# EAGLE design cloudline_controller (EAGLE 9.6.2)
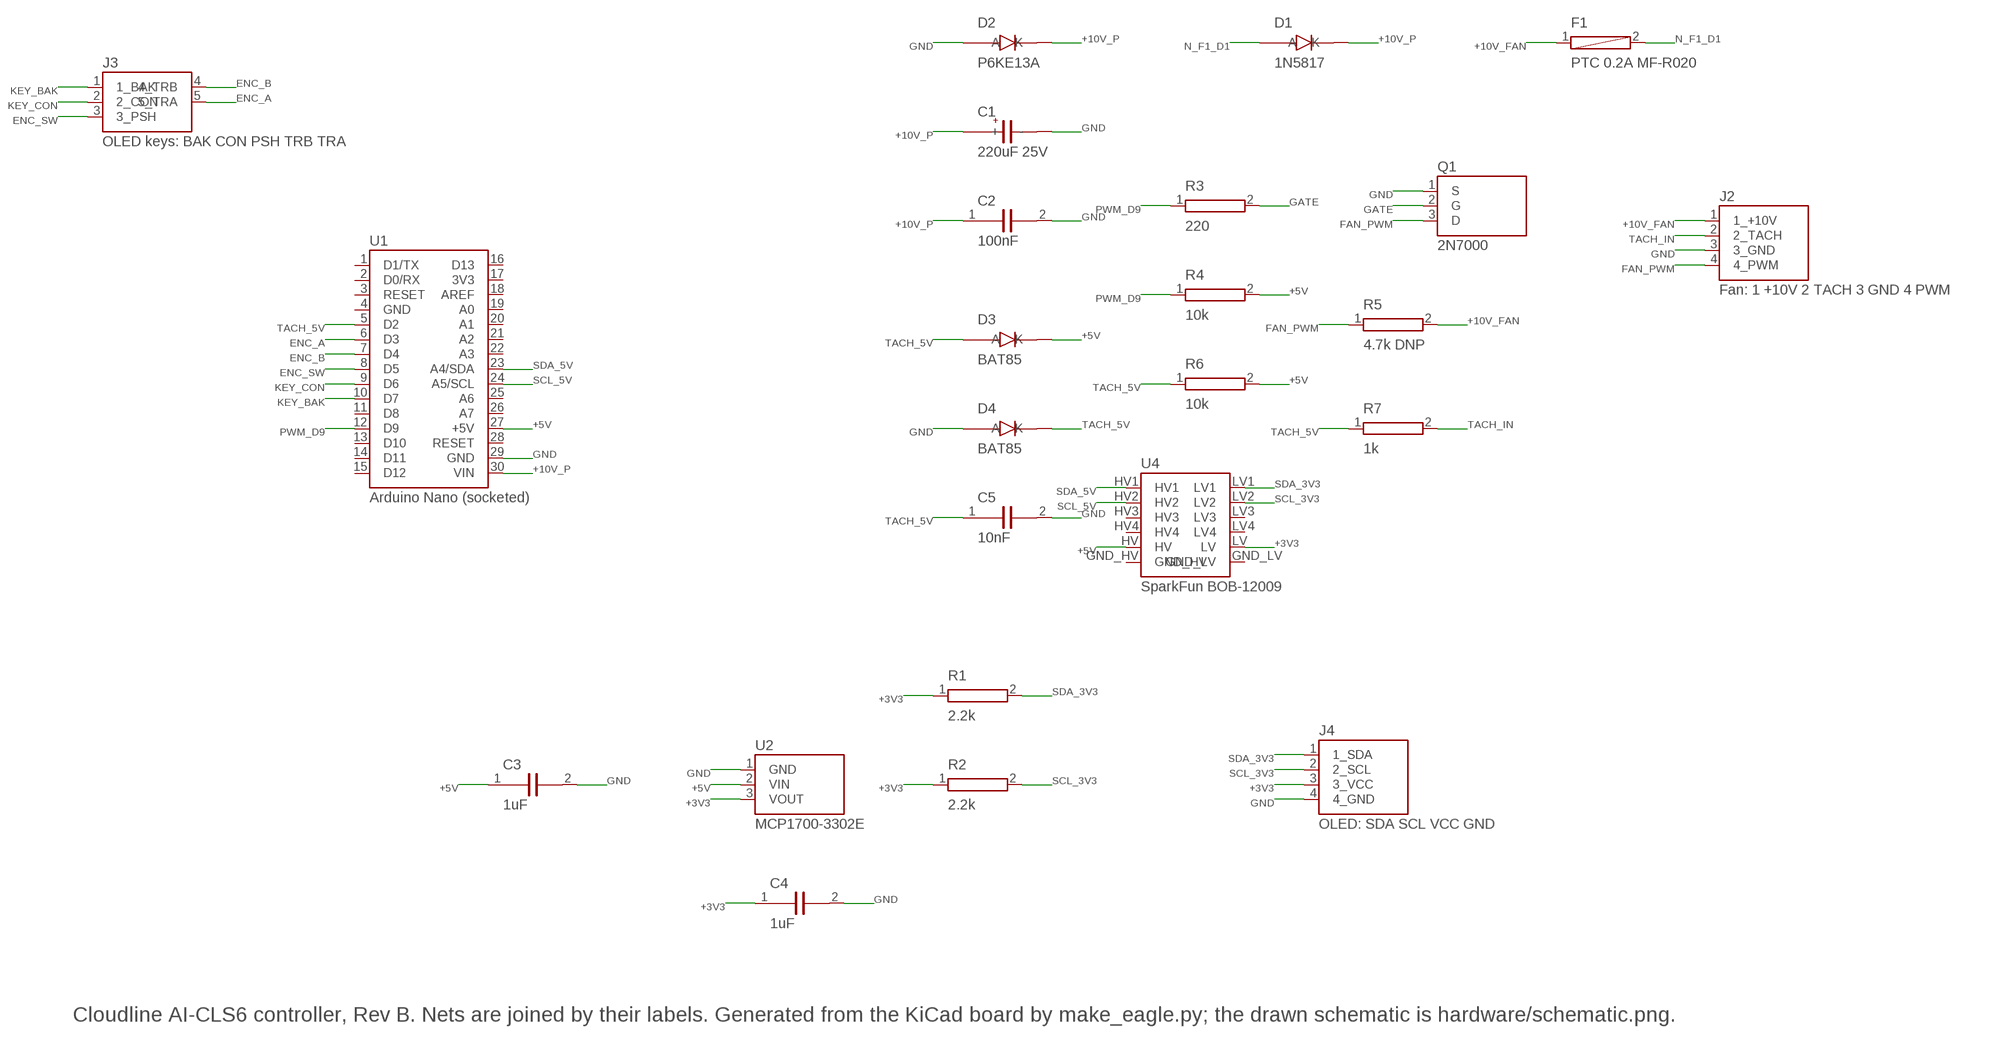
[diagram p0: schematic, sheet 1]

## Parts
C1  220uF 25V  DEV_C1  [CP_Radial_D8.0mm_P3.50mm]
C2  100nF  DEV_C2  [C_Disc_D5.0mm_W2.5mm_P5.00mm]
C3  1uF  DEV_C3  [C_Disc_D5.0mm_W2.5mm_P5.00mm]
C4  1uF  DEV_C4  [C_Disc_D5.0mm_W2.5mm_P5.00mm]
C5  10nF  DEV_C5  [C_Disc_D5.0mm_W2.5mm_P5.00mm]
D1  1N5817  DEV_D1  [D_DO-41_SOD81_P10.16mm_Horizontal]
D2  P6KE13A  DEV_D2  [D_DO-15_P12.70mm_Horizontal]
D3  BAT85  DEV_D3  [D_DO-34_SOD68_P7.62mm_Horizontal]
D4  BAT85  DEV_D4  [D_DO-34_SOD68_P7.62mm_Horizontal]
F1  PTC 0.2A MF-R020  DEV_F1  [PTC_Radial_P5.10mm]
J2  Fan: 1 +10V 2 TACH 3 GND 4 PWM  DEV_J2  [TerminalBlock_Phoenix_MKDS-1_5-4-5.08_1x04_P5.08mm_Horizontal_PAD3.3]
J3  OLED keys: BAK CON PSH TRB TRA  DEV_J3  [PinHeader_1x05_P2.54mm_Vertical]
J4  OLED: SDA SCL VCC GND  DEV_J4  [PinHeader_1x04_P2.54mm_Vertical]
Q1  2N7000  DEV_Q1  [TO-92_Inline_Wide]
R1  2.2k  DEV_R1  [R_Axial_DIN0207_L6.3mm_D2.5mm_P2.54mm_Vertical]
R2  2.2k  DEV_R2  [R_Axial_DIN0207_L6.3mm_D2.5mm_P2.54mm_Vertical]
R3  220  DEV_R3  [R_Axial_DIN0207_L6.3mm_D2.5mm_P7.62mm_Horizontal]
R4  10k  DEV_R4  [R_Axial_DIN0207_L6.3mm_D2.5mm_P10.16mm_Horizontal]
R5  4.7k DNP  DEV_R5  [R_Axial_DIN0207_L6.3mm_D2.5mm_P10.16mm_Horizontal]
R6  10k  DEV_R6  [R_Axial_DIN0207_L6.3mm_D2.5mm_P7.62mm_Horizontal]
R7  1k  DEV_R7  [R_Axial_DIN0207_L6.3mm_D2.5mm_P10.16mm_Horizontal]
U1  Arduino Nano (socketed)  DEV_U1  [Arduino_Nano]
U2  MCP1700-3302E  DEV_U2  [TO-92_Inline_Wide]
U4  SparkFun BOB-12009  DEV_U4  [SparkFun_BOB-12009]

## Nets
+3V3: C4.1 J4.3(3_VCC) R1.1 R2.1 U2.3(VOUT) U4.LV
+5V [power]: C3.1 D3.1(K) R4.2 R6.2 U1.27(+5V) U2.2(VIN) U4.HV
+10V_FAN [power]: F1.1 J2.1(1_+10V) R5.2
+10V_P [power]: C1.1(+) C2.1 D1.1(K) D2.1(K) U1.30(VIN)
ENC_A: J3.5(5_TRA) U1.6(D3)
ENC_B: J3.4(4_TRB) U1.7(D4)
ENC_SW: J3.3(3_PSH) U1.8(D5)
FAN_PWM: J2.4(4_PWM) Q1.3(D) R5.1
GATE: Q1.2(G) R3.2
GND [power]: C1.2(-) C2.2 C3.2 C4.2 C5.2 D2.2(A) D4.2(A) J2.3(3_GND) J4.4(4_GND) Q1.1(S) U1.29(GND) U2.1(GND)
KEY_BAK: J3.1(1_BAK) U1.10(D7)
KEY_CON: J3.2(2_CON) U1.9(D6)
N_F1_D1 [power]: D1.2(A) F1.2
PWM_D9: R3.1 R4.1 U1.12(D9)
SCL_3V3: J4.2(2_SCL) R2.2 U4.LV2
SCL_5V: U1.24(A5/SCL) U4.HV2
SDA_3V3: J4.1(1_SDA) R1.2 U4.LV1
SDA_5V: U1.23(A4/SDA) U4.HV1
TACH_5V: C5.1 D3.2(A) D4.1(K) R6.1 R7.1 U1.5(D2)
TACH_IN: J2.2(2_TACH) R7.2
Unconnected: U1.1(D1/TX) U1.2(D0/RX) U1.3(RESET) U1.4(GND) U1.11(D8) U1.13(D10) U1.14(D11) U1.15(D12) U1.16(D13) U1.17(3V3) U1.18(AREF) U1.19(A0) U1.20(A1) U1.21(A2) U1.22(A3) U1.25(A6) U1.26(A7) U1.28(RESET) U4.GND_HV U4.GND_LV U4.HV3 U4.HV4 U4.LV3 U4.LV4

## Notes on the sheet
- Cloudline AI-CLS6 controller, Rev B. Nets are joined by their labels. Generated from the KiCad board by make_eagle.py; the drawn schematic is hardware/schematic.png.

## Library data of the parts
C1 = cloudline:DEV_C1
C2 = cloudline:DEV_C2
C3 = cloudline:DEV_C3
C4 = cloudline:DEV_C4
C5 = cloudline:DEV_C5
D1 = cloudline:DEV_D1
D2 = cloudline:DEV_D2
D3 = cloudline:DEV_D3
D4 = cloudline:DEV_D4
F1 = cloudline:DEV_F1
J2 = cloudline:DEV_J2
J3 = cloudline:DEV_J3
J4 = cloudline:DEV_J4
Q1 = cloudline:DEV_Q1
R1 = cloudline:DEV_R1
R2 = cloudline:DEV_R2
R3 = cloudline:DEV_R3
R4 = cloudline:DEV_R4
R5 = cloudline:DEV_R5
R6 = cloudline:DEV_R6
R7 = cloudline:DEV_R7
U1 = cloudline:DEV_U1
U2 = cloudline:DEV_U2
U4 = cloudline:DEV_U4

## Net classes
0 default: width 0.5 mm, clearance 0.6 mm
1 power: width 0.8 mm, clearance 0.6 mm, clearance 0.6 mm to class 0

## Board
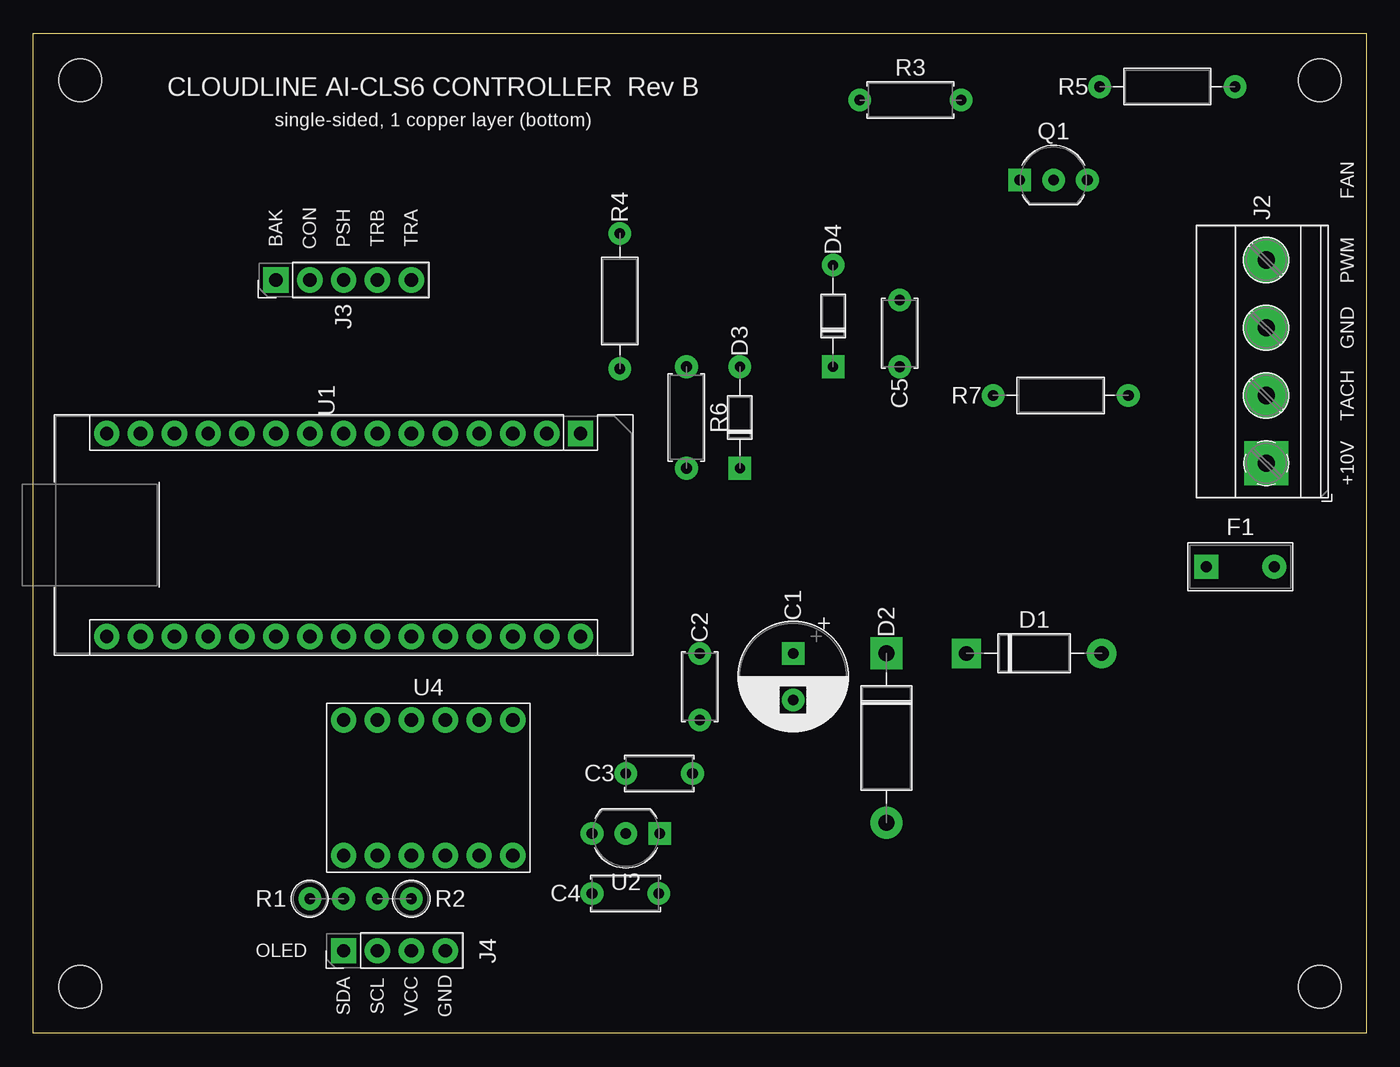
[diagram p1: board, top side]
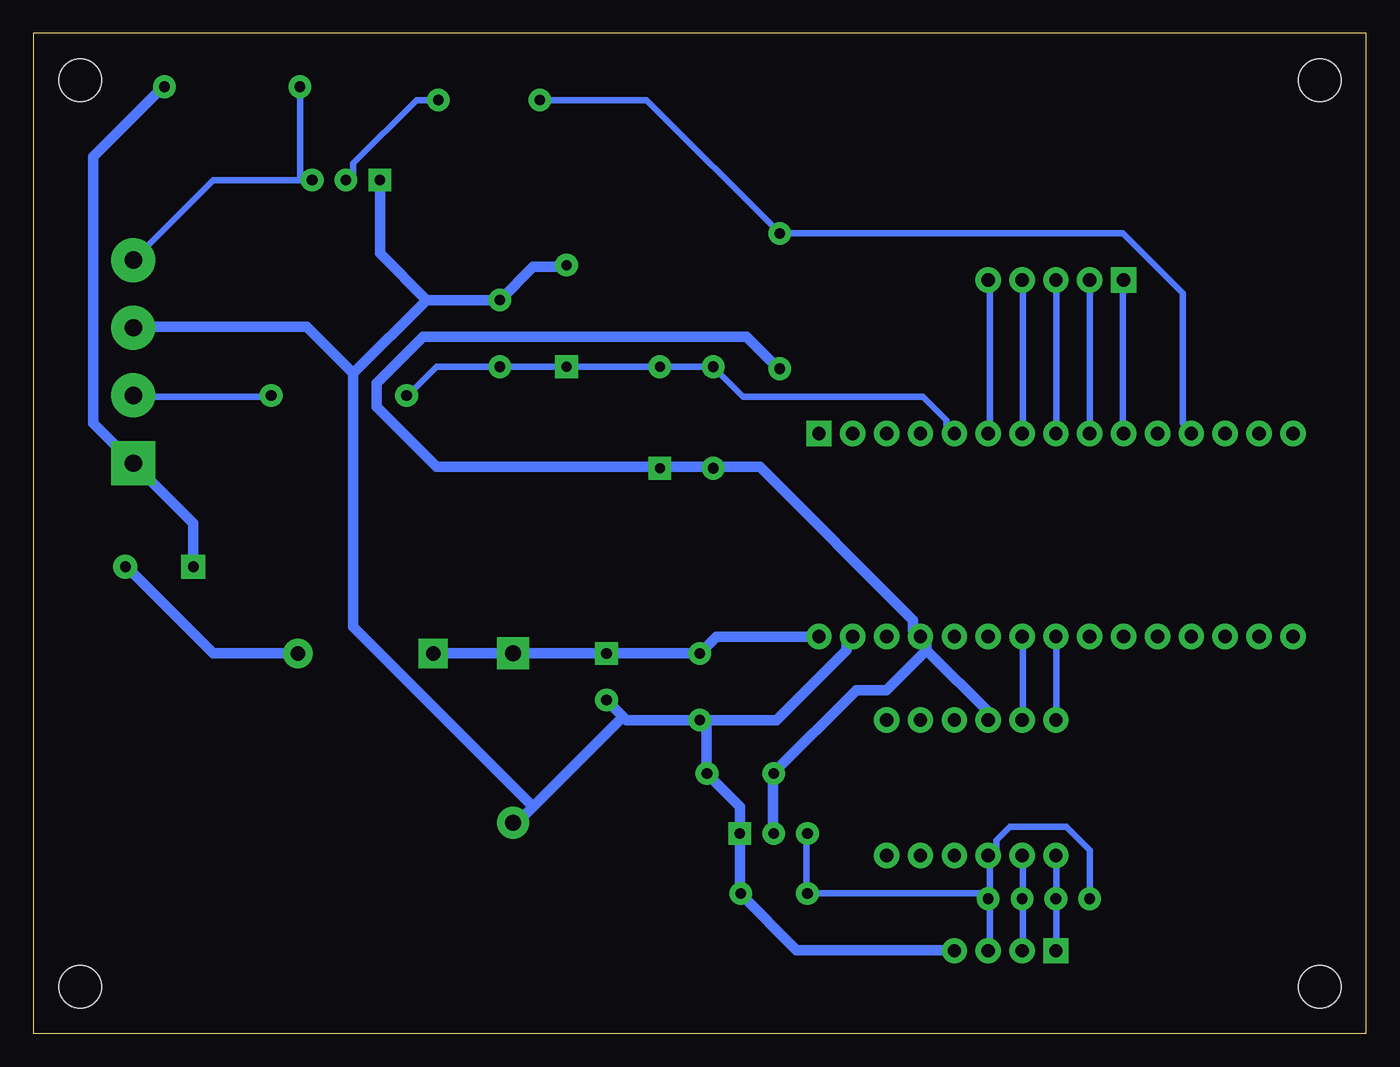
[diagram p2: board, bottom side, seen from below]

Size 100 x 75 mm. Coordinates in mm from the lower left corner, seen from the top.
Outline: 0,0 0,75 100,75 100,0 0,0
Copper layers (1*16): Top 0.035mm / dielectric 1.5mm / Bottom
Design rules "cloudline_single_sided": minimum track width 0.4mm, minimum drill 0.7mm, track to track 0.6mm, track to pad 0.6mm, pad to pad 0.6mm, via to via 0.6mm, smd to smd 0.6mm, copper to edge 0.8mm, drill to drill 0.25mm, minimum pad ring 0.25mm
Holes 3.2 mm at 96.5,3.5 3.5,71.5 3.5,3.5 96.5,71.5

### Footprints (pad centres in the part's own frame; a part is rotated, then mirrored left to right if it is on the bottom)
CP_Radial_D8.0mm_P3.50mm = drill 0.8 pad 1.7 square: 1 0,0 | drill 0.8 pad 1.7 round: 2 3.5,0
C_Disc_D5.0mm_W2.5mm_P5.00mm = drill 0.8 pad 1.7 round: 1 0,0; 2 5,0
D_DO-41_SOD81_P10.16mm_Horizontal = drill 1.1 pad 2.2 square: 1 0,0 | drill 1.1 pad 2.2 round: 2 10.16,0
D_DO-15_P12.70mm_Horizontal = drill 1.2 pad 2.4 square: 1 0,0 | drill 1.2 pad 2.4 round: 2 12.7,0
D_DO-34_SOD68_P7.62mm_Horizontal = drill 0.75 pad 1.7 square: 1 0,0 | drill 0.75 pad 1.7 round: 2 7.62,0
PTC_Radial_P5.10mm = drill 0.8 pad 1.8 square: 1 0,0 | drill 0.8 pad 1.8 round: 2 5.1,0
TerminalBlock_Phoenix_MKDS-1_5-4-5.08_1x04_P5.08mm_Horizontal_PAD3.3 = drill 1.3 pad 3.3 square: 1 0,0 | drill 1.3 pad 3.3 round: 2 5.08,0; 3 10.16,0; 4 15.24,0
PinHeader_1x05_P2.54mm_Vertical = drill 1 pad 1.9 square: 1 0,0 | drill 1 pad 1.9 round: 2 0,-2.54; 3 0,-5.08; 4 0,-7.62; 5 0,-10.16
PinHeader_1x04_P2.54mm_Vertical = drill 1 pad 1.9 square: 1 0,0 | drill 1 pad 1.9 round: 2 0,-2.54; 3 0,-5.08; 4 0,-7.62
TO-92_Inline_Wide = drill 0.8 pad 1.7 square: 1 0,0 | drill 0.8 pad 1.7 round: 2 2.54,0; 3 5.08,0
R_Axial_DIN0207_L6.3mm_D2.5mm_P2.54mm_Vertical = drill 0.8 pad 1.7 round: 1 0,0; 2 2.54,0
R_Axial_DIN0207_L6.3mm_D2.5mm_P7.62mm_Horizontal = drill 0.8 pad 1.7 round: 1 0,0; 2 7.62,0
R_Axial_DIN0207_L6.3mm_D2.5mm_P10.16mm_Horizontal = drill 0.8 pad 1.7 round: 1 0,0; 2 10.16,0
Arduino_Nano = drill 1 pad 1.9 square: 1 0,0 | drill 1 pad 1.9 round: 2 0,-2.54; 3 0,-5.08; 4 0,-7.62; 5 0,-10.16; 6 0,-12.7; 7 0,-15.24; 8 0,-17.78; 9 0,-20.32; 10 0,-22.86; 11 0,-25.4; 12 0,-27.94; 13 0,-30.48; 14 0,-33.02; 15 0,-35.56; 16 15.24,-35.56; 17 15.24,-33.02; 18 15.24,-30.48; 19 15.24,-27.94; 20 15.24,-25.4; 21 15.24,-22.86; 22 15.24,-20.32; 23 15.24,-17.78; 24 15.24,-15.24; 25 15.24,-12.7; 26 15.24,-10.16; 27 15.24,-7.62; 28 15.24,-5.08; 29 15.24,-2.54; 30 15.24,0
SparkFun_BOB-12009 = drill 1 pad 1.9 round: GND_HV 7.62,0; GND_LV 7.62,-10.16; HV 5.08,0; HV1 0,0; HV2 2.54,0; HV3 10.16,0; HV4 12.7,0; LV 5.08,-10.16; LV1 0,-10.16; LV2 2.54,-10.16; LV3 10.16,-10.16; LV4 12.7,-10.16

### Placement (x,y rotation side)
C1  57,28.5 270 top
C2  50,28.5 270 top
C3  44.46,19.5 0 top
C4  41.92,10.5 0 top
C5  65,50 90 top
D1  70,28.5 0 top
D2  64,28.5 270 top
D3  53,42.38 90 top
D4  60,50 90 top
F1  88,35 0 top
J2  92.5,42.76 90 top
J3  18.2,56.5 90 top
J4  23.28,6.2 90 top
Q1  74,64 0 top
R1  20.74,10.1 0 top
R2  28.36,10.1 180 top
R3  62,70 0 top
R4  44,60 270 top
R5  80,71 0 top
R6  49,50 270 top
R7  72,47.84 0 top
U1  41.06,45 270 top
U2  47,15 180 top
U4  23.28,23.5 0 top

### Tracks (layer width: path | path; a pad name or v marks a point on that pad's centre or on a via)
+3V3
  Bottom 0.5: 20.75,10 20.75,13.75 22.5,15.5 26.75,15.5 27.75,14.5 27.75,13.75 28.25,13.25 28.25,10 28.25,6.25 | 28.25,10.5 42,10.5 42,15
+5V
  Bottom 0.8: 44.5,15 44.5,19.5 38.25,25.75 36,25.75 33,28.75 | 28.25,23.5 28.25,24 33,28.75 | 44,49.75 46.5,52.25 70.75,52.25 74.25,48.75 74.25,47 69.75,42.5 53,42.5 49,42.5 45.5,42.5 34,31 34,30.25 33.5,29.75 33,29.25 33,28.75
+10V_FAN
  Bottom 0.8: F1.1 88,38.25 J2.1 95.5,45.75 95.5,65.75 90.25,71
+10V_P
  Bottom 0.8: 41,29.75 48.75,29.75 C2.1 C1.1 D2.1 D1.1
ENC_A
  Bottom 0.5: 28.25,45 28.25,56.5
ENC_B
  Bottom 0.5: 25.75,45 25.75,56.5
ENC_SW
  Bottom 0.5: 23.25,45 23.25,56.5
FAN_PWM
  Bottom 0.5: 79,64 86.5,64 J2.4 | 80,64 R5.1
GATE
  Bottom 0.5: 69.5,70 71.25,70 76,65.25 76,64.5 76.5,64
GND
  Bottom 0.8: 70.5,55 C5.2 62.5,57.5 60,57.5 | Q1.1 74,58.5 70.5,55 | 38.5,29.75 39,29.25 39,28.75 44.25,23.5 C2.2 55.5,23.5 C1.2 | 31,6.25 42.75,6.25 47,10.5 U2.1 47,17 49.5,19.5 49.5,23.5 | 64,15.75 63.75,15.75 55.75,23.75 | 76,49.5 76,30.5 62.5,17 | 76,49.5 79.5,53 92.5,53 | 76,49.5 70.5,55
KEY_BAK
  Bottom 0.5: 18.25,45 18.25,56.5
KEY_CON
  Bottom 0.5: U1.9 J3.2
N_F1_D1
  Bottom 0.8: 80.25,28.5 86.5,28.5 93,35
PWM_D9
  Bottom 0.5: R3.1 54,70 R4.1 18.25,60 13.75,55.5 13.75,45.75 13,45
SCL_3V3
  Bottom 0.5: 25.75,13.25 25.75,10 25.75,6.25
SCL_5V
  Bottom 0.5: 25.75,29.75 25.75,23.5
SDA_3V3
  Bottom 0.5: 23.25,6.25 23.25,10 23.25,13.25
SDA_5V
  Bottom 0.5: 23.25,29.75 23.25,23.5
TACH_5V
  Bottom 0.5: 31,45 31.5,45.5 31.5,46 33.25,47.75 46.75,47.75 R6.1 D3.2 D4.1 C5.1 69.75,50 72,47.75
TACH_IN
  Bottom 0.5: 92.5,47.75 82.25,47.75

### Text on the board
tPlace: CLOUDLINE AI-CLS6 CONTROLLER Rev B | single-sided, 1 copper layer (bottom) | FAN | BAK | CON | PSH | TRB | TRA | PWM | GND | TACH | +10V | OLED | SDA | SCL | VCC | GND
Document: Single-sided: copper on Bottom (16) only. Generated from KiCad by make_eagle.py.